# Altium schematic sheet Power_Analog.SchDoc: 02 - Fontes analogicas e desacoplamento
size A3; Project: CM5 Photonic Bias Controller; DocumentRev: R5; ProjectRev: R5; Version: Rev R6; SheetNumber: 3; SheetTotal: 17; Author: Carlos Renan; SCH_SCALE: N/A; Address1: UFCG; Address2: Referencia: VIRTUS CC; Address3: Campina Grande - PB; ProjectName: Controle automatico de BIAS para MZM/IQ - Projeto 3; DocumentName: Power_Analog.SchDoc
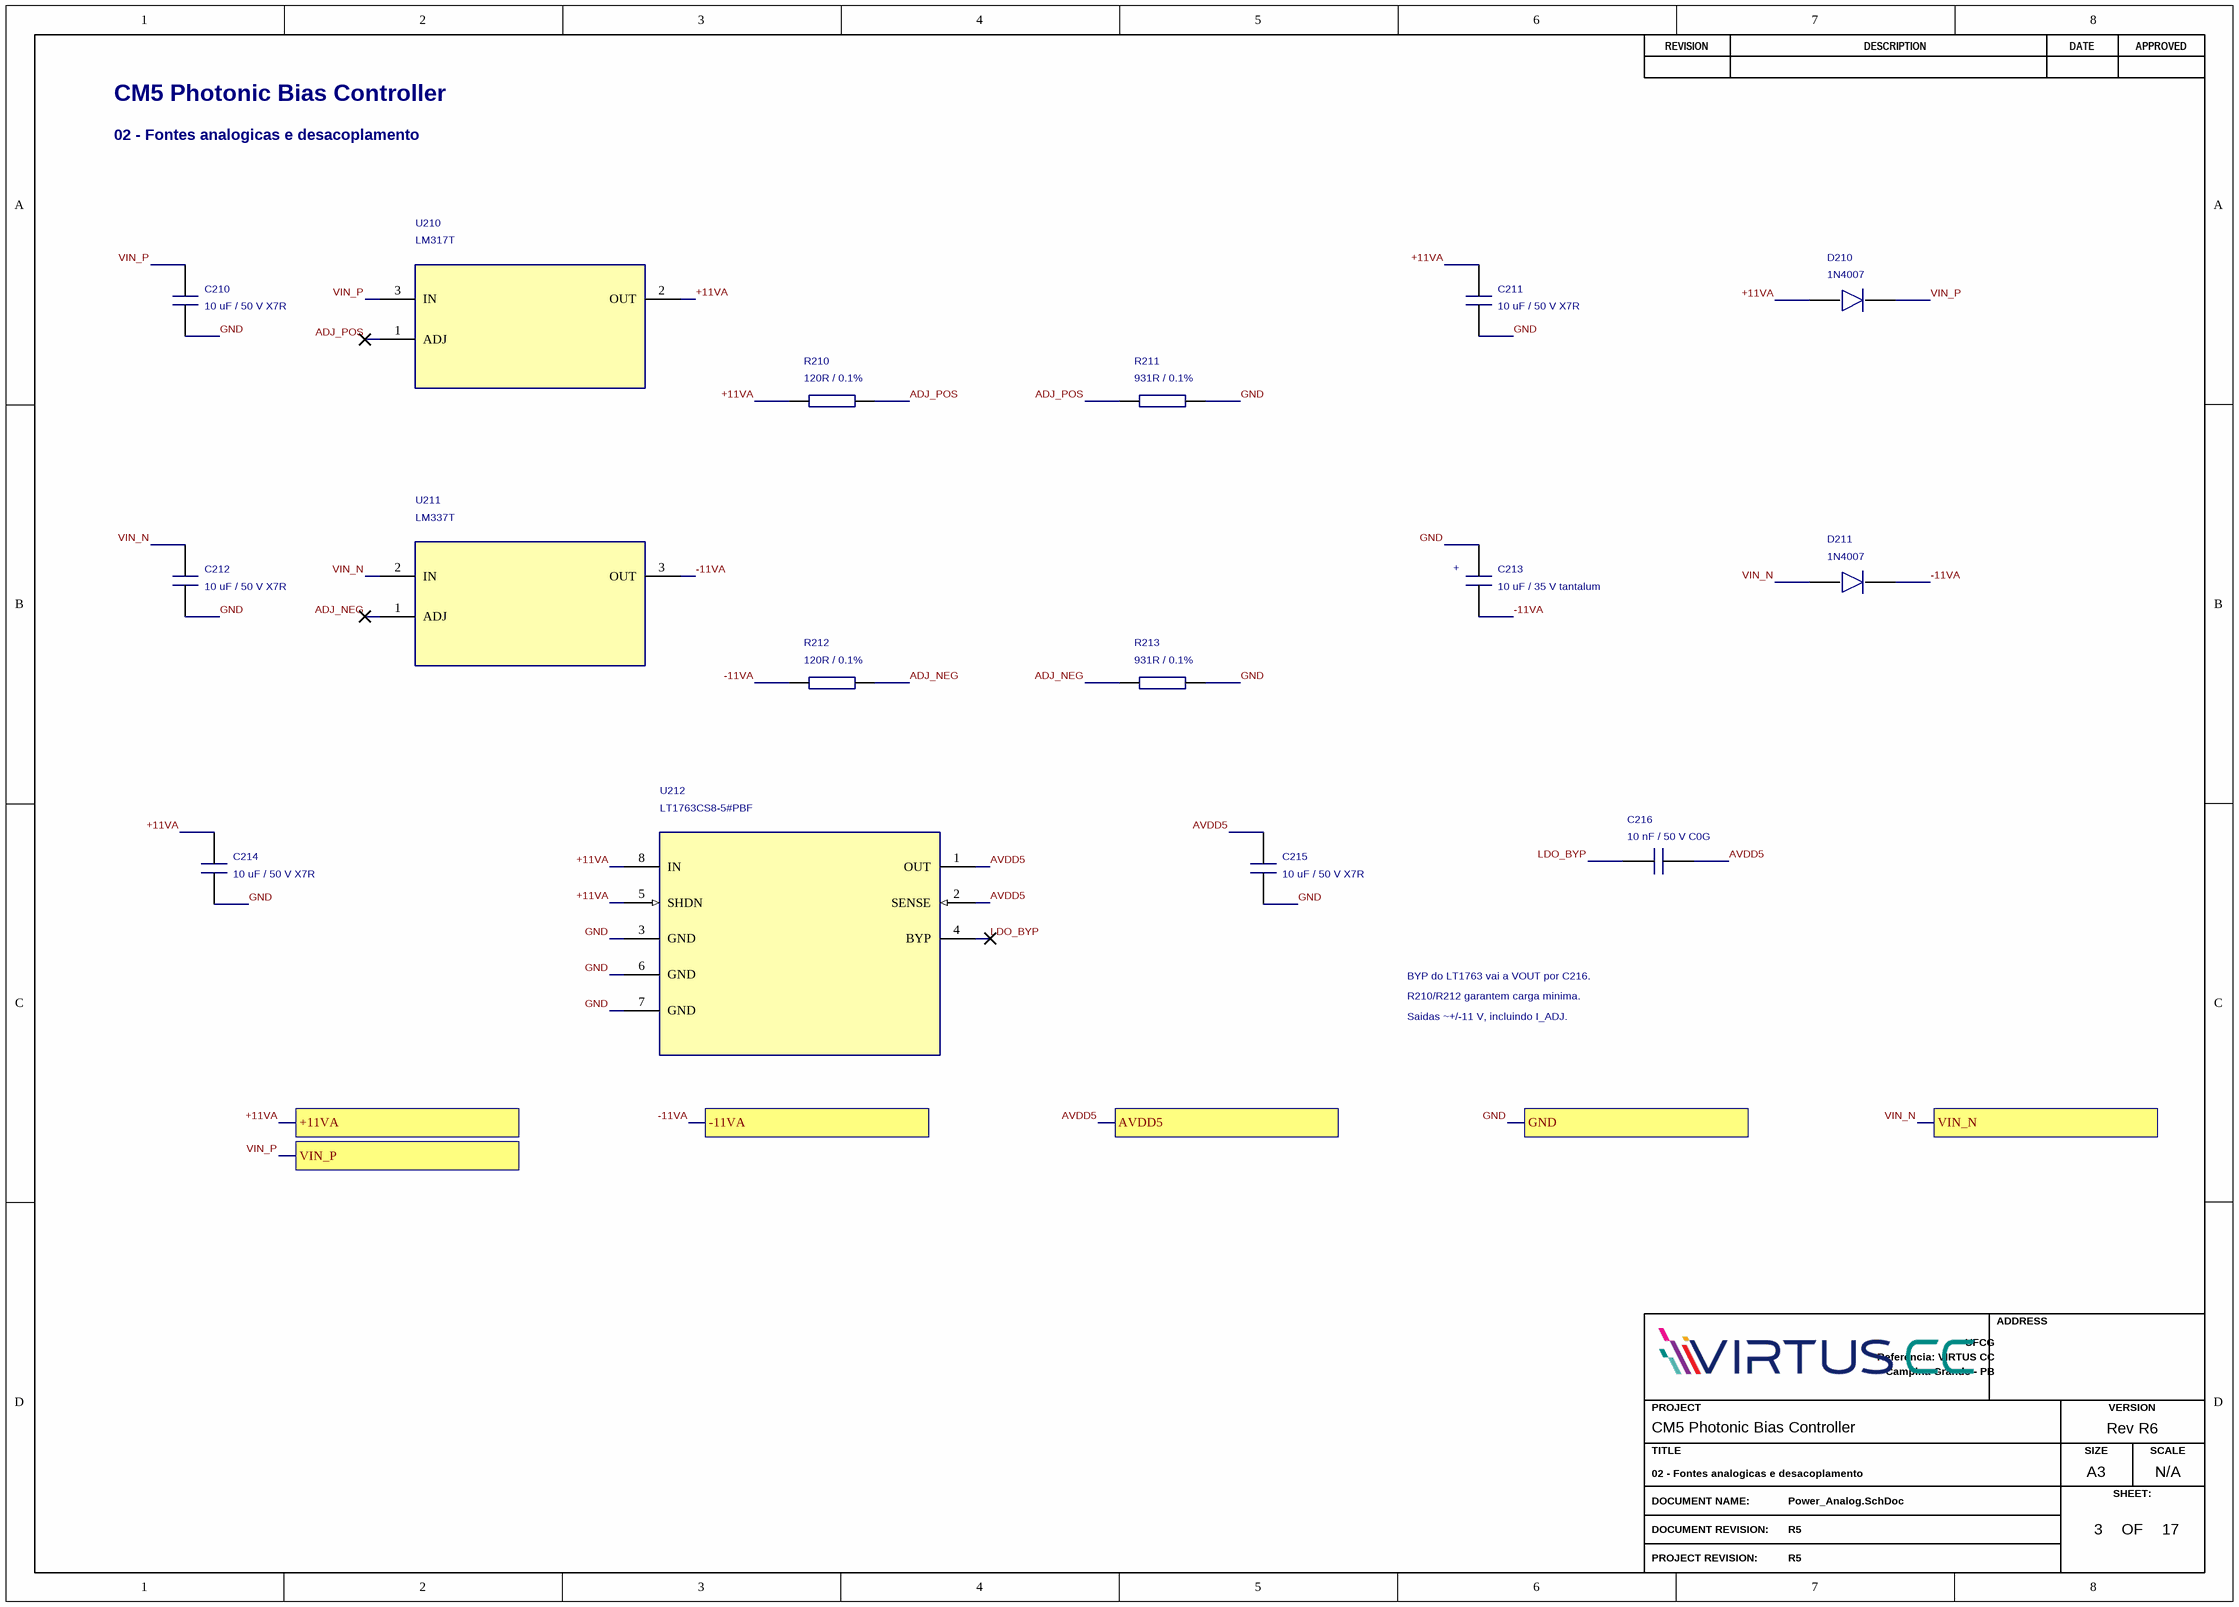
[diagram p0: Power_Analog.SchDoc]

## Parts
C210  10 uF / 50 V X7R  [C1210]
C211  10 uF / 50 V X7R  [C1210]
C212  10 uF / 50 V X7R  [C1210]
C213  10 uF / 35 V tantalum  [TANT_D]
C214  10 uF / 50 V X7R  [C1210]
C215  10 uF / 50 V X7R  [C1210]
C216  10 nF / 50 V C0G  [C0805]
D210  1N4007  [D_DO41_P10]
D211  1N4007  [D_DO41_P10]
R210  120R / 0.1%  [R-0603]
R211  931R / 0.1%  [R-0603]
R212  120R / 0.1%  [R-0603]
R213  931R / 0.1%  [R-0603]
U210  LM317T  [TO220_3]
U211  LM337T  [TO220_3]
U212  LT1763CS8-5#PBF  [SOIC8]

## Ports
+11VA, -11VA, AVDD5, GND, VIN_N, VIN_P

## Nets
+11VA: C211.1 C214.1 D210.2(A) R210.1 U210.2(OUT) U212.5(SHDN) U212.8(IN) ; port +11VA
-11VA: C213.2 D211.1(K) R212.1 U211.3(OUT) ; port -11VA
ADJ_NEG: R212.2 R213.1 U211.1(ADJ)
ADJ_POS: R210.2 R211.1 U210.1(ADJ)
AVDD5: C215.1 C216.2 U212.1(OUT) U212.2(SENSE) ; port AVDD5
GND: C210.2 C211.2 C212.2 C213.1 C214.2 C215.2 R211.2 R213.2 U212.3(GND) U212.6(GND) U212.7(GND) ; port GND
LDO_BYP: C216.1 U212.4(BYP)
VIN_N: C212.1 D211.2(A) U211.2(IN) ; port VIN_N
VIN_P: C210.1 D210.1(K) U210.3(IN) ; port VIN_P

## Notes on the sheet
- CM5 Photonic Bias Controller
- 02 - Fontes analogicas e desacoplamento
- BYP do LT1763 vai a VOUT por C216.
- R210/R212 garantem carga minima.
- Saidas ~+/-11 V, incluindo I_ADJ.
- REVISION
- DESCRIPTION
- DATE
- APPROVED
- ADDRESS
- PROJECT
- VERSION
- TITLE
- A3
- SIZE
- SCALE
- DOCUMENT NAME:
- DOCUMENT REVISION:
- OF
- SHEET:
- PROJECT REVISION:
- (in symbol 10 uF) +

## Library data of the parts
C210-C212 C214 C215 = 10 uF: Manufacturer: KEMET; Manufacturer Part Number: C1210C106K5RACTU; Procurement Status: Busca por MPN; SKU e disponibilidade a confirmar; BOM Purchase: Yes; Manufacturer 1: KEMET; Manufacturer Part Number 1: C1210C106K5RACTU; Supplier 1: DigiKey; Supplier URL 1: https://www.digikey.com.br/pt/products/result?keywords=C1210C106K5RACTU; Supplier 2: Mouser; Supplier URL 2: https://br.mouser.com/c/?q=C1210C106K5RACTU; Datasheet: https://www.yageogroup.com/download/specsheet/C1210C106K5RACTU
C213 = 10 uF: Manufacturer: KEMET; Manufacturer Part Number: T491D106K035AT; Review: Tantalo caso D; positivo pad 1 ao GND, negativo pad 2 a -11VA; ESR max 3 ohm.; Procurement Status: Busca por MPN; SKU e disponibilidade a confirmar; BOM Purchase: Yes; Manufacturer 1: KEMET; Manufacturer Part Number 1: T491D106K035AT; Supplier 1: DigiKey; Supplier URL 1: https://www.digikey.com.br/pt/products/result?keywords=T491D106K035AT; Supplier 2: Mouser; Supplier URL 2: https://br.mouser.com/c/?q=T491D106K035AT; Datasheet: https://www.yageogroup.com/download/specsheet/T491D106K035AT
C216 = 10 nF: Manufacturer: KEMET; Manufacturer Part Number: C0805C103J5GACTU; Procurement Status: Busca por MPN; SKU e disponibilidade a confirmar; BOM Purchase: Yes; Manufacturer 1: KEMET; Manufacturer Part Number 1: C0805C103J5GACTU; Supplier 1: DigiKey; Supplier URL 1: https://www.digikey.com.br/pt/products/result?keywords=C0805C103J5GACTU; Supplier 2: Mouser; Supplier URL 2: https://br.mouser.com/c/?q=C0805C103J5GACTU; Datasheet: https://www.yageogroup.com/download/specsheet/C0805C103J5GACTU
D210 D211 = 1N4007: Manufacturer: Vishay; Manufacturer Part Number: 1N4007-E3/54; Procurement Status: Busca por MPN; SKU e disponibilidade a confirmar; BOM Purchase: Yes; Manufacturer 1: Vishay; Manufacturer Part Number 1: 1N4007-E3/54; Supplier 1: DigiKey; Supplier URL 1: https://www.digikey.com.br/pt/products/result?keywords=1N4007-E3%2F54; Supplier 2: Mouser; Supplier URL 2: https://br.mouser.com/c/?q=1N4007-E3%2F54; Datasheet: https://www.vishay.com/docs/88503/1n4001.pdf
R210 R212 = 120R: Manufacturer: YAGEO; Manufacturer Part Number: RT0603BRD07120RL; Review: Filme fino, 0,1%, 25 ppm/K; 0,1 W. Verificar dissipacao em R210/R212 e matching dos drivers.; Procurement Status: Busca por MPN; SKU e disponibilidade a confirmar; BOM Purchase: Yes; Manufacturer 1: YAGEO; Manufacturer Part Number 1: RT0603BRD07120RL; Supplier 1: DigiKey; Supplier URL 1: https://www.digikey.com.br/pt/products/result?keywords=RT0603BRD07120RL; Supplier 2: Mouser; Supplier URL 2: https://br.mouser.com/c/?q=RT0603BRD07120RL; Datasheet: https://www.yageo.com/en/Product/Index/rchip
R211 R213 = 931R: Manufacturer: YAGEO; Manufacturer Part Number: RT0603BRD07931RL; Review: Filme fino, 0,1%, 25 ppm/K; 0,1 W. Verificar dissipacao em R210/R212 e matching dos drivers.; Procurement Status: Busca por MPN; SKU e disponibilidade a confirmar; BOM Purchase: Yes; Manufacturer 1: YAGEO; Manufacturer Part Number 1: RT0603BRD07931RL; Supplier 1: DigiKey; Supplier URL 1: https://www.digikey.com.br/pt/products/result?keywords=RT0603BRD07931RL; Supplier 2: Mouser; Supplier URL 2: https://br.mouser.com/c/?q=RT0603BRD07931RL; Datasheet: https://www.yageo.com/en/Product/Index/rchip
U210 = LM317T: Manufacturer: STMicroelectronics; Procurement Status: Busca por MPN; SKU e disponibilidade a confirmar; BOM Purchase: Yes; Manufacturer Part Number: LM317T; Manufacturer 1: STMicroelectronics; Manufacturer Part Number 1: LM317T; Supplier 1: DigiKey; Supplier URL 1: https://www.digikey.com.br/pt/products/result?keywords=LM317T; Supplier 2: Mouser; Supplier URL 2: https://br.mouser.com/c/?q=LM317T; Datasheet: https://www.st.com/resource/en/datasheet/lm317.pdf
U211 = LM337T: Manufacturer: STMicroelectronics; Procurement Status: Busca por MPN; SKU e disponibilidade a confirmar; BOM Purchase: Yes; Manufacturer Part Number: LM337T; Manufacturer 1: STMicroelectronics; Manufacturer Part Number 1: LM337T; Supplier 1: DigiKey; Supplier URL 1: https://www.digikey.com.br/pt/products/result?keywords=LM337T; Supplier 2: Mouser; Supplier URL 2: https://br.mouser.com/c/?q=LM337T; Datasheet: https://www.st.com/resource/en/datasheet/lm337.pdf
U212 = LT1763CS8-5#PBF: Manufacturer: Analog Devices; Procurement Status: Busca por MPN; SKU e disponibilidade a confirmar; BOM Purchase: Yes; Manufacturer Part Number: LT1763CS8-5#PBF; Manufacturer 1: Analog Devices; Manufacturer Part Number 1: LT1763CS8-5#PBF; Supplier 1: DigiKey; Supplier URL 1: https://www.digikey.com.br/pt/products/result?keywords=LT1763CS8-5%23PBF; Supplier 2: Mouser; Supplier URL 2: https://br.mouser.com/c/?q=LT1763CS8-5%23PBF; Datasheet: https://www.analog.com/media/en/technical-documentation/data-sheets/1763fg.pdf